# Altium schematic sheet Peripherals.SchDoc (part 2 of 2)
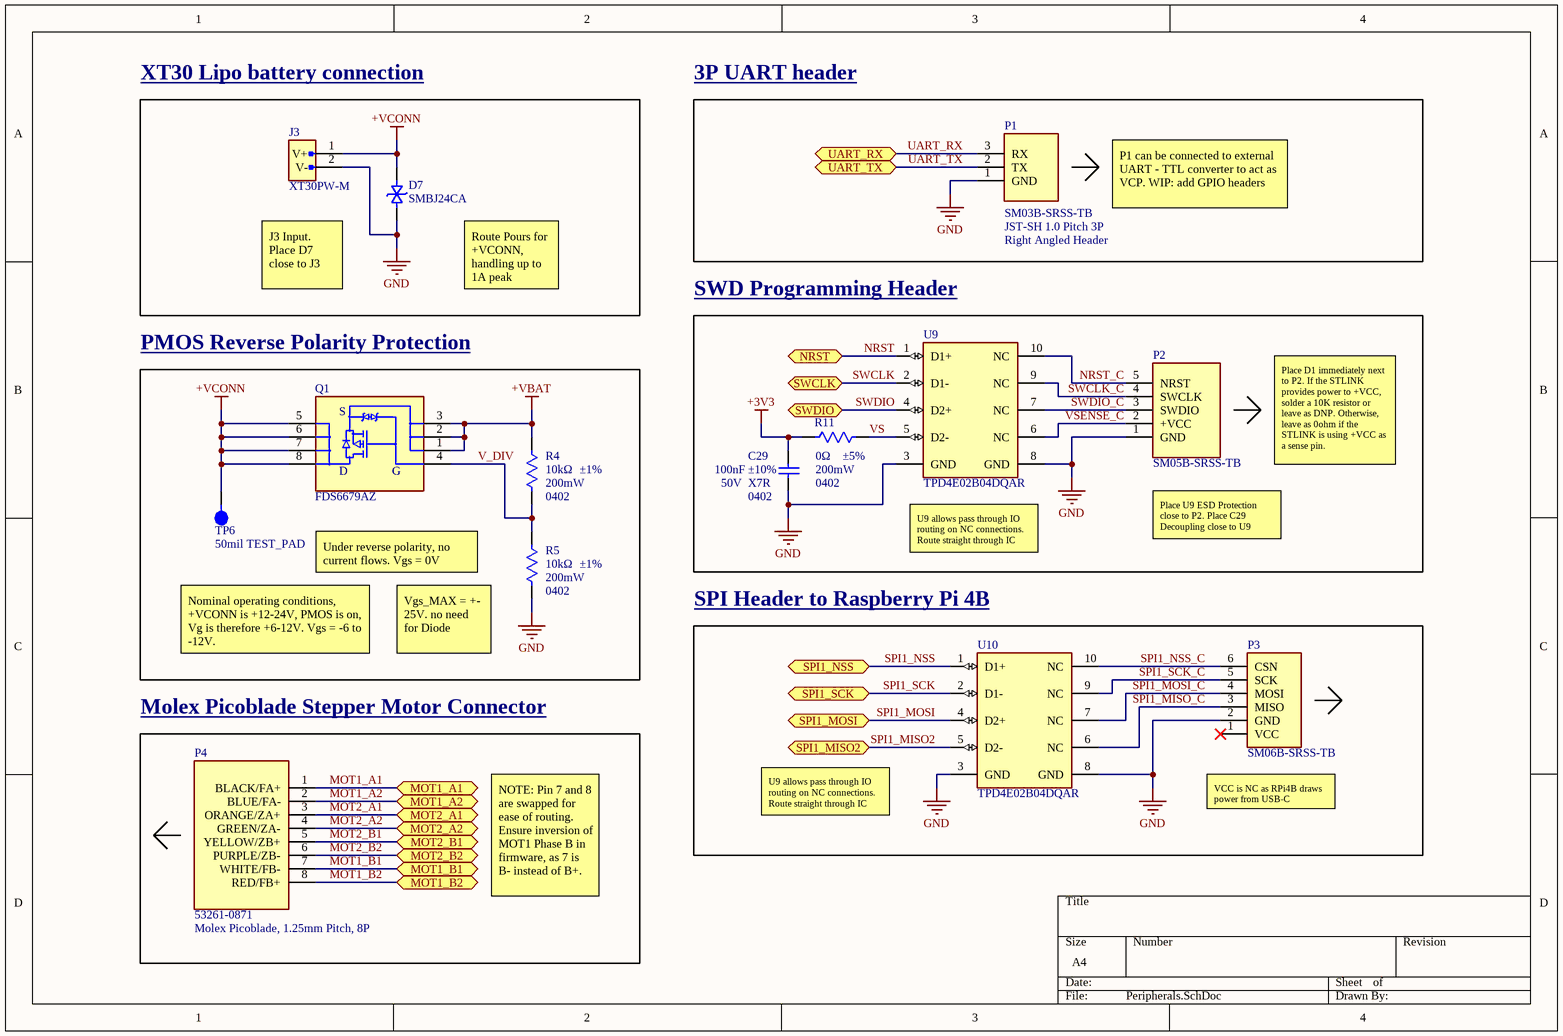
[diagram p1: Peripherals.SchDoc]

## Library data of the parts
C29 = GCM155R71H104KE02J: 50V 100nF X7R ±10% 0402 Multilayer Ceramic Capacitors MLCC - SMD/SMT ROHS; Manufacturer: Murata; Manufacturer Lifecycle Status: IN PRODUCTION; Supplier 1: DigiKey; Manufacturer Part Number: GCM155R71H104KE02J; RoHS: Compliant; Category: Ceramic Capacitors; Stock 1: 13930662; Pricing 1: 1=0.1, 10=0.034, 50=0.0226, 100=0.0193, 500=0.01374, 1000=0.01205, 2500=0.01027, 5000=0.0092 (USD); Case Code (Imperial): 0402; Case Code (Metric): 1005; Country of Origin: Philippines; Dielectric Material: Ceramic; Export Control Classification Number (ECCN) Code: EAR99; Height: 500µm; Harmonized Tariff Schedule (HTS) Code: 8532.24.00.20; Introduction Date: 2013-11-20; Length: 1mm; Lifecycle Status: Production; Material: Ceramic; Max Operating Temperature: 125°C; Min Operating Temperature: -55°C; Mount: Surface Mount; Number of Terminals: 2; Packaging: Tape & Reel (TR); Ratings: AEC-Q200; REACH SVHC: Yes; Schedule B: 8532240020, 8532240020|8532240020, 8532240020|8532240020|8532240020, 8532240020|8532240020|8532240020|8532240020; Termination: SMD/SMT; Voltage Rating (DC): 50V; Weight: 6.010099mg; Width: 500µm; ComponentLink1URL: https://datasheet.octopart.com:443/GCM155R71H104KE02J-Murata-datasheet-155345015.pdf?src-supplier=Newark; ComponentLink1Description: https://datasheet.octopart.com:443/GCM155R71H104KE02J-Murata-datasheet-155345015.pdf?src-supplier=Newark; ComponentLink2URL: https://datasheet.octopart.com:443/GCM155R71H104KE02J-Murata-datasheet-178519985.pdf?src-supplier=Arrow.cn; ComponentLink2Description: https://datasheet.octopart.com:443/GCM155R71H104KE02J-Murata-datasheet-178519985.pdf?src-supplier=Arrow.cn; ComponentLink3URL: https://datasheet.octopart.com:443/GCM155R71H104KE02J-Murata-datasheet-141266224.pdf?src-supplier=Ciiva; ComponentLink3Description: https://datasheet.octopart.com:443/GCM155R71H104KE02J-Murata-datasheet-141266224.pdf?src-supplier=Ciiva; ComponentLink4URL: https://datasheet.octopart.com:443/GCM155R71H104KE02J-Murata-datasheet-140656751.pdf?src-supplier=Ciiva; ComponentLink4Description: https://datasheet.octopart.com:443/GCM155R71H104KE02J-Murata-datasheet-140656751.pdf?src-supplier=Ciiva; ComponentLink5URL: https://datasheet.octopart.com:443/GCM155R71H104KE02J-Murata-datasheet-138716456.pdf?src-supplier=Ciiva; ComponentLink5Description: https://datasheet.octopart.com:443/GCM155R71H104KE02J-Murata-datasheet-138716456.pdf?src-supplier=Ciiva; ComponentLink6URL: https://datasheet.octopart.com:443/GCM155R71H104KE02J-Murata-datasheet-77992203.pdf?src-supplier=Future+Electronics; ComponentLink6Description: https://datasheet.octopart.com:443/GCM155R71H104KE02J-Murata-datasheet-77992203.pdf?src-supplier=Future+Electronics; ComponentLink7URL: https://datasheet.octopart.com:443/GCM155R71H104KE02J-Murata-datasheet-12511495.pdf?src-supplier=TME; ComponentLink7Description: https://datasheet.octopart.com:443/GCM155R71H104KE02J-Murata-datasheet-12511495.pdf?src-supplier=TME; ComponentLink8URL: http://sigma.octopart.com:80/reach_statement/Murata-company-16.pdf?src-supplier=Compliance+Statements; ComponentLink8Description: http://sigma.octopart.com:80/reach_statement/Murata-company-16.pdf?src-supplier=Compliance+Statements; Supplier Part Number 1: 490-14514-6-ND; Capacitance: 100nF
D7 = SMBJ24CA: Diode; 15.5 A (Max.); 26.70 V (Min.) @ 1 mA; 5 uA (Max.) @ 24 V; 100 A (Max.); Manufacturer: Littelfuse; Breakdown Voltage: 28.1V; Clamping Voltage: 38.9V; Direction: Bidirectional; Element Configuration: Single; ESD Protection: Yes; Leakage Current: 1µA; Max Breakdown Voltage: 29.5V; Max Junction Temperature (Tj): 150°C; Max Power Dissipation: 5W; Max Surge Current: 15.5A; Min Breakdown Voltage: 26.7V; Number of Bidirectional Channels: 1; Operating Supply Voltage: 24V; Peak Pulse Power: 600W; Power Line Protection: No; Test Current: 1mA; Supplier 1: Arrow Electronics; Manufacturer Part Number: SMBJ24CA; RoHS: Compliant; Category: TVS Diodes; Stock 1: 36000; Pricing 1: 3000=0.0667 (USD); Case/Package: SMB; China RoHS: Non-Compliant; Composition: Zener; Country of Origin: Mainland China, Philippines; Export Control Classification Number (ECCN) Code: EAR99; Height: 2.61mm; Harmonized Tariff Schedule (HTS) Code: 8541.10.00.50; Introduction Date: 1996-01-01; Lead Free: Lead Free; Length: 4.5466mm; Lifecycle Status: Production; Max Operating Temperature: 150°C; Max Reverse Leakage Current: 1µA; Min Operating Temperature: -65°C; Mount: Surface Mount; Number of Channels: 1; Number of Elements: 1; Number of Pins: 2; Number of Terminals: 2; Packaging: Tape & Reel; Peak Pulse Current: 15.5A; Peak Reverse Current: 1µA; Polarity: Bidirectional; Power Rating: 600W; Radiation Hardening: No; REACH SVHC: No; Reverse Breakdown Voltage: 26.7V; Reverse Standoff Voltage: 24V; Reverse Voltage: 24V; Schedule B: 8541100080, 8541100080|8541100080|8541100080|8541100080|8541100080; Termination: SMD/SMT; Voltage Rating (DC): 24V; Width: 3.937mm; ComponentLink1URL: https://datasheet.octopart.com:443/SMBJ24CA-Littelfuse-datasheet-180609570.pdf?src-supplier=IHS; ComponentLink1Description: https://datasheet.octopart.com:443/SMBJ24CA-Littelfuse-datasheet-180609570.pdf?src-supplier=IHS; ComponentLink2URL: https://datasheet.octopart.com:443/SMBJ24CA-Littelfuse-datasheet-27889791.pdf?src-supplier=Upverter; ComponentLink2Description: https://datasheet.octopart.com:443/SMBJ24CA-Littelfuse-datasheet-27889791.pdf?src-supplier=Upverter; ComponentLink3URL: https://datasheet.octopart.com:443/SMBJ24CA-Littelfuse-datasheet-63710821.pdf?src-supplier=Farnell; ComponentLink3Description: https://datasheet.octopart.com:443/SMBJ24CA-Littelfuse-datasheet-63710821.pdf?src-supplier=Farnell; ComponentLink4URL: https://datasheet.octopart.com:443/SMBJ24CA-Littelfuse-datasheet-145017494.pdf?src-supplier=Farnell; ComponentLink4Description: https://datasheet.octopart.com:443/SMBJ24CA-Littelfuse-datasheet-145017494.pdf?src-supplier=Farnell; ComponentLink5URL: https://datasheet.octopart.com:443/SMBJ24CA-Littelfuse-datasheet-10854588.pdf?src-supplier=element14+APAC; ComponentLink5Description: https://datasheet.octopart.com:443/SMBJ24CA-Littelfuse-datasheet-10854588.pdf?src-supplier=element14+APAC; ComponentLink6URL: https://datasheet.octopart.com:443/SMBJ24CA-Littelfuse-datasheet-5319440.pdf?src-supplier=element14+APAC; ComponentLink6Description: https://datasheet.octopart.com:443/SMBJ24CA-Littelfuse-datasheet-5319440.pdf?src-supplier=element14+APAC; ComponentLink7URL: https://datasheet.octopart.com:443/SMBJ24CA-Littelfuse-datasheet-98958142.pdf?src-supplier=LKR; ComponentLink7Description: https://datasheet.octopart.com:443/SMBJ24CA-Littelfuse-datasheet-98958142.pdf?src-supplier=LKR; ComponentLink8URL: https://datasheet.octopart.com:443/SMBJ24CA-Littelfuse-datasheet-871.pdf?src-supplier=Newark; ComponentLink8Description: https://datasheet.octopart.com:443/SMBJ24CA-Littelfuse-datasheet-871.pdf?src-supplier=Newark; ComponentLink9URL: https://datasheet.octopart.com:443/SMBJ24CA-Littelfuse-datasheet-123574.pdf?src-supplier=Newark; ComponentLink9Description: https://datasheet.octopart.com:443/SMBJ24CA-Littelfuse-datasheet-123574.pdf?src-supplier=Newark; ComponentLink10URL: https://datasheet.octopart.com:443/SMBJ24CA-Littelfuse-datasheet-9692587.pdf?src-supplier=RS+(Formerly+Allied+Electronics); ComponentLink10Description: https://datasheet.octopart.com:443/SMBJ24CA-Littelfuse-datasheet-9692587.pdf?src-supplier=RS+(Formerly+Allied+Electronics); ComponentLink11URL: https://datasheet.octopart.com:443/SMBJ24CA-Littelfuse-datasheet-22888.pdf?src-supplier=RS+(Formerly+Allied+Electronics); ComponentLink11Description: https://datasheet.octopart.com:443/SMBJ24CA-Littelfuse-datasheet-22888.pdf?src-supplier=RS+(Formerly+Allied+Electronics); Supplier Part Number 1: SMBJ24CA
J3 = XT30PW-M: Socket; DC supply; XT30; male; PIN: 2; on PCBs; THT; Colour: yellow; MF: AMASS; SnapEDA_Link: https://www.snapeda.com/parts/XT30PW-M/AMASS/view-part/?ref=snap; Package: None; Value: *; MP: XT30PW-M; Check_prices: https://www.snapeda.com/parts/XT30PW-M/AMASS/view-part/?ref=eda
P1 = SM03B-SRSS-TB_UART: Board Connector, 3 Contact(s), 1 Row(s), Male, Right Angle, Surface Mount Terminal; Manufacturer: JST; Connector Type: Male Pin; Number of Contacts: 3; Pitch: 990.6µm; Supplier 1: DigiKey; Manufacturer Part Number: SM03B-SRSS-TB; RoHS: Compliant; Category: Card Edge Connectors; Stock 1: 14167; Pricing 1: 1=0.44, 10=0.373, 100=0.317, 500=0.2829, 1000=0.26938 (USD); Color: Natural; Contact Gender: Male; Contact Plating: Tin; Housing Color: Natural; Housing Material: Nylon; Lead Free: Contains Lead; Lifecycle Status: Obsolete; Max Operating Temperature: 85°C; Min Operating Temperature: -25°C; Mount: Surface Mount; Number of Pins: 3; Number of Positions: 3; Number of Rows: 1; Orientation: Horizontal; Terminal Pitch: 1mm; Termination: Solder; ComponentLink1URL: https://datasheet.octopart.com:443/SM03B-SRSS-TB-JST-datasheet-180492086.pdf?src-supplier=IHS; ComponentLink1Description: https://datasheet.octopart.com:443/SM03B-SRSS-TB-JST-datasheet-180492086.pdf?src-supplier=IHS; ComponentLink2URL: https://datasheet.octopart.com:443/SM03B-SRSS-TB-JST-datasheet-44103209.pdf?src-supplier=TME; ComponentLink2Description: https://datasheet.octopart.com:443/SM03B-SRSS-TB-JST-datasheet-44103209.pdf?src-supplier=TME; ComponentLink3URL: https://datasheet.octopart.com:443/SM03B-SRSS-TB-JST-datasheet-118603.pdf?src-supplier=DigiKey; ComponentLink3Description: https://datasheet.octopart.com:443/SM03B-SRSS-TB-JST-datasheet-118603.pdf?src-supplier=DigiKey; ComponentLink4URL: https://datasheet.octopart.com:443/SM03B-SRSS-TB-JST-datasheet-152738602.pdf?src-supplier=Amar+Radio+Corporation; ComponentLink4Description: https://datasheet.octopart.com:443/SM03B-SRSS-TB-JST-datasheet-152738602.pdf?src-supplier=Amar+Radio+Corporation
P2 = SM05B-SRSS-TB-SWD: Board Connector, 5 Contact(s), 1 Row(s), Male, Right Angle, Surface Mount Terminal; Manufacturer: JST; Connector Type: Male Pin; Number of Contacts: 5; Pitch: 990.6µm; Supplier 1: DigiKey; Manufacturer Part Number: SM05B-SRSS-TB; RoHS: Compliant; Category: Card Edge Connectors; Stock 1: 42194; Pricing 1: 1=0.62, 10=0.527, 100=0.4477, 500=0.3996, 1000=0.38051 (USD); Color: Natural; Contact Plating: Tin; Export Control Classification Number (ECCN) Code: EAR99; Gender: Male; Housing Color: Natural; Housing Material: Nylon; Harmonized Tariff Schedule (HTS) Code: 8536.69.40.40; Introduction Date: 1996-04-01; Lead Free: Contains Lead; Lifecycle Status: Obsolete; Mount: Surface Mount; Number of Positions: 5; Number of Rows: 1; Orientation: Right Angle; Terminal Pitch: 1mm; Termination: Solder; ComponentLink1URL: https://datasheet.octopart.com:443/SM05B-SRSS-TB-JST-datasheet-180492086.pdf?src-supplier=IHS; ComponentLink1Description: https://datasheet.octopart.com:443/SM05B-SRSS-TB-JST-datasheet-180492086.pdf?src-supplier=IHS; ComponentLink2URL: https://datasheet.octopart.com:443/SM05B-SRSS-TB-JST-datasheet-118603.pdf?src-supplier=DigiKey; ComponentLink2Description: https://datasheet.octopart.com:443/SM05B-SRSS-TB-JST-datasheet-118603.pdf?src-supplier=DigiKey; ComponentLink3URL: https://datasheet.octopart.com:443/SM05B-SRSS-TB-JST-datasheet-152738602.pdf?src-supplier=Amar+Radio+Corporation; ComponentLink3Description: https://datasheet.octopart.com:443/SM05B-SRSS-TB-JST-datasheet-152738602.pdf?src-supplier=Amar+Radio+Corporation
P3 = SM06B-SRSS-TB_SPI: Board Connector, 6 Contact(s), 1 Row(s), Male, Right Angle, 0.039 inch Pitch, Surface Mount Terminal; Manufacturer: JST; Connector Type: Male Pin; Dielectric Material: Polyamide; Number of Contacts: 6; Pitch: 990.6µm; Supplier 1: DigiKey; Manufacturer Part Number: SM06B-SRSS-TB; RoHS: Compliant; Category: Card Edge Connectors; Stock 1: 26532; Pricing 1: 1=0.67, 10=0.567, 100=0.4821, 500=0.43024, 1000=0.40969 (USD); Color: Natural; Contact Gender: Male; Contact Plating: Tin; Housing Color: Natural; Housing Material: Nylon; Lead Free: Contains Lead; Lifecycle Status: Obsolete; Max Operating Temperature: 85°C; Manufacturer Package Identifier: SM06B-SRSS-TB; Min Operating Temperature: -25°C; Mount: Surface Mount; Number of Pins: 6; Number of Positions: 6; Number of Rows: 1; Orientation: Horizontal; Terminal Pitch: 1mm; Termination: Solder; ComponentLink1URL: https://datasheet.octopart.com:443/SM06B-SRSS-TB-JST-datasheet-118603.pdf?src-supplier=Upverter; ComponentLink1Description: https://datasheet.octopart.com:443/SM06B-SRSS-TB-JST-datasheet-118603.pdf?src-supplier=Upverter; ComponentLink2URL: https://datasheet.octopart.com:443/SM06B-SRSS-TB-JST-datasheet-180492086.pdf?src-supplier=IHS; ComponentLink2Description: https://datasheet.octopart.com:443/SM06B-SRSS-TB-JST-datasheet-180492086.pdf?src-supplier=IHS; ComponentLink3URL: https://datasheet.octopart.com:443/SM06B-SRSS-TB-JST-datasheet-44103209.pdf?src-supplier=TME; ComponentLink3Description: https://datasheet.octopart.com:443/SM06B-SRSS-TB-JST-datasheet-44103209.pdf?src-supplier=TME; ComponentLink4URL: https://datasheet.octopart.com:443/SM06B-SRSS-TB-JST-datasheet-152738602.pdf?src-supplier=Amar+Radio+Corporation; ComponentLink4Description: https://datasheet.octopart.com:443/SM06B-SRSS-TB-JST-datasheet-152738602.pdf?src-supplier=Amar+Radio+Corporation
P4 = 53261-0871: 1.25mm (.049") Pitch PicoBlade Header, Surface Mount, Right Angle, Lead-free, 8 Circuits; Manufacturer: Molex; Manufacturer Lifecycle Status: ACTIVE; Contact Resistance: 20mΩ; Current Rating: 1A; Gender: Male; Glow Wire Compliant: Non-compliant; Insulation Resistance: 100MΩ; Number of Circuits: 7; Number of Contacts: 8; Pitch: 1.2446mm; Plating: Tin; Plating Thickness: 990.6nm; Ratings: CSA; Voltage Rating: 125V; Supplier 1: DigiKey; Manufacturer Part Number: 53261-0871; RoHS: Compliant; Category: Headers and Wire Housings; Stock 1: 32917; Pricing 1: 1=0.91, 10=0.772, 100=0.6556, 500=0.58518 (USD); Ambient Temperature Range High: 105°C; China RoHS: Compliant; Color: Beige; Contact Material: Nickel, Tin; Contact Plating: Tin; Country of Origin: SG; Flammability Rating: UL94 V-0; Height: 3.6mm; Lead Free: Lead Free; Lead Pitch: 1.25mm; Lifecycle Status: Production; Max Operating Temperature: 105°C; Min Operating Temperature: -40°C; Mount: Surface Mount; Number of Pins: 8; Number of Positions: 8; Number of Rows: 1; Orientation: Right Angle; Packaging: Cut Tape; Radiation Hardening: No; REACH SVHC: Yes; Schedule B: 8536694040, 8536694040|8536694040|8536694040|8536694040|8536694040|8536694040|8536694040|8536694040|8536694040|8536694040|8536694040|8536694040|8536694040|8536694040|8536694040|8536694040|8536694040|8536694040|8536694040|8536694040|8536694040|8536694040|8536694040|85; Terminal Pitch: 1.25mm; Termination: Solder; Voltage Rating (AC): 125V; Voltage Rating (DC): 125V; Working Voltage: 125V; ComponentLink1URL: https://datasheet.octopart.com:443/53261-0871-Molex-datasheet-177725531.pdf?src-supplier=Farnell; ComponentLink1Description: https://datasheet.octopart.com:443/53261-0871-Molex-datasheet-177725531.pdf?src-supplier=Farnell; ComponentLink2URL: https://datasheet.octopart.com:443/53261-0871-Molex-datasheet-11023919.pdf?src-supplier=Farnell; ComponentLink2Description: https://datasheet.octopart.com:443/53261-0871-Molex-datasheet-11023919.pdf?src-supplier=Farnell; ComponentLink3URL: https://datasheet.octopart.com:443/53261-0871-Molex-datasheet-101583405.pdf?src-supplier=Farnell; ComponentLink3Description: https://datasheet.octopart.com:443/53261-0871-Molex-datasheet-101583405.pdf?src-supplier=Farnell; ComponentLink4URL: https://datasheet.octopart.com:443/532610871-Molex-datasheet-520094.pdf?src-supplier=Farnell; ComponentLink4Description: https://datasheet.octopart.com:443/532610871-Molex-datasheet-520094.pdf?src-supplier=Farnell; ComponentLink5URL: https://sigma.octopart.com:443/140425834/technical_drawing/Molex-53261-0871.pdf?src-supplier=Upverter; ComponentLink5Description: https://sigma.octopart.com:443/140425834/technical_drawing/Molex-53261-0871.pdf?src-supplier=Upverter; ComponentLink6URL: https://datasheet.octopart.com:443/53261-0871-Molex-datasheet-140462602.pdf?src-supplier=Upverter; ComponentLink6Description: https://datasheet.octopart.com:443/53261-0871-Molex-datasheet-140462602.pdf?src-supplier=Upverter; ComponentLink7URL: https://datasheet.octopart.com:443/53261-0871-Molex-datasheet-12537161.pdf?src-supplier=_legacy+Avnet; ComponentLink7Description: https://datasheet.octopart.com:443/53261-0871-Molex-datasheet-12537161.pdf?src-supplier=_legacy+Avnet; ComponentLink8URL: https://datasheet.octopart.com:443/532610871-Molex-datasheet-8343080.pdf?src-supplier=TME; ComponentLink8Description: https://datasheet.octopart.com:443/532610871-Molex-datasheet-8343080.pdf?src-supplier=TME; ComponentLink9URL: https://datasheet.octopart.com:443/53261-0871-Molex-datasheet-10404416.pdf?src-supplier=Molex; ComponentLink9Description: https://datasheet.octopart.com:443/53261-0871-Molex-datasheet-10404416.pdf?src-supplier=Molex; ComponentLink10URL: https://sigma.octopart.com:443/16413766/technical_drawing/Molex-53261-0871.pdf?src-supplier=Molex; ComponentLink10Description: https://sigma.octopart.com:443/16413766/technical_drawing/Molex-53261-0871.pdf?src-supplier=Molex; ComponentLink11URL: https://datasheet.octopart.com:443/53261-0871-Molex-datasheet-154756037.pdf?src-supplier=Master+Electronics; ComponentLink11Description: https://datasheet.octopart.com:443/53261-0871-Molex-datasheet-154756037.pdf?src-supplier=Master+Electronics; ComponentLink12URL: https://datasheet.octopart.com:443/53261-0871-Molex-datasheet-21208676.pdf?src-supplier=Electro+Sonic; ComponentLink12Description: https://datasheet.octopart.com:443/53261-0871-Molex-datasheet-21208676.pdf?src-supplier=Electro+Sonic; ComponentLink13URL: https://datasheet.octopart.com:443/53261-0871-Molex-datasheet-62105452.pdf?src-supplier=Electro+Sonic; ComponentLink13Description: https://datasheet.octopart.com:443/53261-0871-Molex-datasheet-62105452.pdf?src-supplier=Electro+Sonic; ComponentLink14URL: https://datasheet.octopart.com:443/53261-0871-Molex-datasheet-8522546.pdf?src-supplier=element14; ComponentLink14Description: https://datasheet.octopart.com:443/53261-0871-Molex-datasheet-8522546.pdf?src-supplier=element14; ComponentLink15URL: https://datasheet.octopart.com:443/53261-0871-Molex-datasheet-100429.pdf?src-supplier=element14; ComponentLink15Description: https://datasheet.octopart.com:443/53261-0871-Molex-datasheet-100429.pdf?src-supplier=element14; ComponentLink16URL: https://datasheet.octopart.com:443/0532610871-Molex-datasheet-157440116.pdf?src-supplier=Sager+Electronics; ComponentLink16Description: https://datasheet.octopart.com:443/0532610871-Molex-datasheet-157440116.pdf?src-supplier=Sager+Electronics; ComponentLink17URL: https://datasheet.octopart.com:443/53261-0871-Molex-datasheet-140186590.pdf?src-supplier=RS+(Formerly+Allied+Electronics); ComponentLink17Description: https://datasheet.octopart.com:443/53261-0871-Molex-datasheet-140186590.pdf?src-supplier=RS+(Formerly+Allied+Electronics); ComponentLink18URL: https://datasheet.octopart.com:443/53261-0871-Molex-datasheet-120153903.pdf?src-supplier=RS+(Formerly+Allied+Electronics); ComponentLink18Description: https://datasheet.octopart.com:443/53261-0871-Molex-datasheet-120153903.pdf?src-supplier=RS+(Formerly+Allied+Electronics); ComponentLink19URL: https://datasheet.octopart.com:443/53261-0871-Molex-datasheet-34442330.pdf?src-supplier=RS+(Formerly+Allied+Electronics); ComponentLink19Description: https://datasheet.octopart.com:443/53261-0871-Molex-datasheet-34442330.pdf?src-supplier=RS+(Formerly+Allied+Electronics); ComponentLink20URL: https://datasheet.octopart.com:443/532610871-Molex-datasheet-137316104.pdf?src-supplier=Future+Electronics; ComponentLink20Description: https://datasheet.octopart.com:443/532610871-Molex-datasheet-137316104.pdf?src-supplier=Future+Electronics; ComponentLink21URL: https://datasheet.octopart.com:443/53261-0871-Molex-datasheet-33003884.pdf?src-supplier=Newark; ComponentLink21Description: https://datasheet.octopart.com:443/53261-0871-Molex-datasheet-33003884.pdf?src-supplier=Newark; ComponentLink22URL: https://datasheet.octopart.com:443/53261-0871-Molex-datasheet-33003883.pdf?src-supplier=Newark; ComponentLink22Description: https://datasheet.octopart.com:443/53261-0871-Molex-datasheet-33003883.pdf?src-supplier=Newark; ComponentLink23URL: https://datasheet.octopart.com:443/0532610871-Molex-datasheet-11889475.pdf?src-supplier=Arrow+Electronics; ComponentLink23Description: https://datasheet.octopart.com:443/0532610871-Molex-datasheet-11889475.pdf?src-supplier=Arrow+Electronics; ComponentLink24URL: https://datasheet.octopart.com:443/53261-0871-Molex-datasheet-17741852.pdf?src-supplier=Jameco+(USA); ComponentLink24Description: https://datasheet.octopart.com:443/53261-0871-Molex-datasheet-17741852.pdf?src-supplier=Jameco+(USA); ComponentLink25URL: https://datasheet.octopart.com:443/53261-0871-Molex-datasheet-145971.pdf?src-supplier=DigiKey; ComponentLink25Description: https://datasheet.octopart.com:443/53261-0871-Molex-datasheet-145971.pdf?src-supplier=DigiKey; ComponentLink26URL: http://sigma.octopart.com:80/16413779/rohs_statement/Molex-53261-0871.pdf?src-supplier=Compliance+Statements; ComponentLink26Description: http://sigma.octopart.com:80/16413779/rohs_statement/Molex-53261-0871.pdf?src-supplier=Compliance+Statements; ComponentLink27URL: http://sigma.octopart.com:80/reach_statement/Molex-company-74.pdf?src-supplier=Compliance+Statements; ComponentLink27Description: http://sigma.octopart.com:80/reach_statement/Molex-company-74.pdf?src-supplier=Compliance+Statements; ComponentLink28URL: http://sigma.octopart.com:80/rohs_statement/Molex-company-73.pdf?src-supplier=Compliance+Statements; ComponentLink28Description: http://sigma.octopart.com:80/rohs_statement/Molex-company-73.pdf?src-supplier=Compliance+Statements; ComponentLink29URL: http://sigma.octopart.com:80/conflict_mineral_statement/Molex-company-72.pdf?src-supplier=Compliance+Statements; ComponentLink29Description: http://sigma.octopart.com:80/conflict_mineral_statement/Molex-company-72.pdf?src-supplier=Compliance+Statements; Supplier Part Number 1: WM7626CT-ND
Q1 = FDS6679AZ: P-Channel 30 V 9.3 mOhm Surface Mount PowerTrench Mosfet - SOIC-8; Manufacturer: onsemi; Manufacturer Lifecycle Status: ACTIVE; Continuous Drain Current (ID): 13A; Current Rating: -13A; Drain to Source Breakdown Voltage: -30V; Drain to Source Resistance: 9.3mΩ; Element Configuration: Single; Fall Time: 92ns; Gate to Source Voltage (Vgs): 25V; Input Capacitance: 3.845nF; Max Junction Temperature (Tj): 150°C; Max Power Dissipation: 2.5W; Min Breakdown Voltage: 30V; Nominal Vgs: -1.9V; Number of Channels: 1; Power Dissipation: 1W; Rise Time: 15ns; Turn-Off Delay Time: 210ns; Turn-On Delay Time: 13ns; Supplier 1: DigiKey; Manufacturer Part Number: FDS6679AZ; RoHS: Compliant; Category: MOSFETs; Stock 1: 5617; Pricing 1: 1=1.6, 10=1.014, 100=0.6743, 500=0.5287, 1000=0.48185 (USD); Case/Package: SOIC; China RoHS: Compliant; Contact Plating: Tin; Country of Origin: Philippines; Drain to Source Voltage (Vdss): -30V; Export Control Classification Number (ECCN) Code: EAR99; Height: 1.75mm; Harmonized Tariff Schedule (HTS) Code: 8541.29.00.95; Introduction Date: 2006-02-10; Lead Free: Lead Free; Length: 5mm; Lifecycle Status: Production; Max Operating Temperature: 150°C; Min Operating Temperature: -55°C; Mount: Surface Mount; Number of Elements: 1; Number of Pins: 8; Number of Terminals: 8; Packaging: Tape & Reel; Radiation Hardening: No; Rds On Max: 9.3mΩ; REACH SVHC: Yes; Resistance: 9.3MΩ; Schedule B: 8541290080, 8541290080|8541290080|8541290080|8541290080|8541290080; Threshold Voltage: -1.9V; Voltage Rating (DC): -30V; Weight: 130mg; Width: 4mm; ComponentLink1URL: https://datasheet.octopart.com:443/FDS6679AZ-ON-Semiconductor-datasheet-5375043.pdf?src-supplier=element14+APAC; ComponentLink1Description: https://datasheet.octopart.com:443/FDS6679AZ-ON-Semiconductor-datasheet-5375043.pdf?src-supplier=element14+APAC; ComponentLink2URL: https://datasheet.octopart.com:443/FDS6679AZ-ON-Semiconductor-datasheet-80928664.pdf?src-supplier=element14+APAC; ComponentLink2Description: https://datasheet.octopart.com:443/FDS6679AZ-ON-Semiconductor-datasheet-80928664.pdf?src-supplier=element14+APAC; ComponentLink3URL: https://datasheet.octopart.com:443/FDS6679AZ-Fairchild-Semiconductor-datasheet-76739748.pdf?src-supplier=element14+APAC; ComponentLink3Description: https://datasheet.octopart.com:443/FDS6679AZ-Fairchild-Semiconductor-datasheet-76739748.pdf?src-supplier=element14+APAC; ComponentLink4URL: https://datasheet.octopart.com:443/FDS6679AZ.-Fairchild-Semiconductor-datasheet-68450872.pdf?src-supplier=element14+APAC; ComponentLink4Description: https://datasheet.octopart.com:443/FDS6679AZ.-Fairchild-Semiconductor-datasheet-68450872.pdf?src-supplier=element14+APAC; ComponentLink5URL: https://datasheet.octopart.com:443/FDS6679AZ.-Fairchild-Semiconductor-datasheet-76739753.pdf?src-supplier=element14+APAC; ComponentLink5Description: https://datasheet.octopart.com:443/FDS6679AZ.-Fairchild-Semiconductor-datasheet-76739753.pdf?src-supplier=element14+APAC; ComponentLink6URL: https://datasheet.octopart.com:443/FDS6679AZ-onsemi-datasheet-164563882.pdf?src-supplier=IHS; ComponentLink6Description: https://datasheet.octopart.com:443/FDS6679AZ-onsemi-datasheet-164563882.pdf?src-supplier=IHS; ComponentLink7URL: https://sigma.octopart.com:443/138897548/technical_drawing/onsemi-FDS6679AZ.pdf?src-supplier=Upverter; ComponentLink7Description: https://sigma.octopart.com:443/138897548/technical_drawing/onsemi-FDS6679AZ.pdf?src-supplier=Upverter; ComponentLink8URL: https://datasheet.octopart.com:443/FDS6679AZ-ON-Semiconductor-datasheet-97399181.pdf?src-supplier=Future+Electronics; ComponentLink8Description: https://datasheet.octopart.com:443/FDS6679AZ-ON-Semiconductor-datasheet-97399181.pdf?src-supplier=Future+Electronics; ComponentLink9URL: https://datasheet.octopart.com:443/FDS6679AZ-ON-Semiconductor-datasheet-86694006.pdf?src-supplier=onsemi; ComponentLink9Description: https://datasheet.octopart.com:443/FDS6679AZ-ON-Semiconductor-datasheet-86694006.pdf?src-supplier=onsemi; ComponentLink10URL: https://datasheet.octopart.com:443/FDS6679AZ-ON-Semiconductor-datasheet-86689283.pdf?src-supplier=Farnell; ComponentLink10Description: https://datasheet.octopart.com:443/FDS6679AZ-ON-Semiconductor-datasheet-86689283.pdf?src-supplier=Farnell; ComponentLink11URL: https://datasheet.octopart.com:443/FDS6679AZ-Fairchild-Semiconductor-datasheet-67356198.pdf?src-supplier=Farnell; ComponentLink11Description: https://datasheet.octopart.com:443/FDS6679AZ-Fairchild-Semiconductor-datasheet-67356198.pdf?src-supplier=Farnell; ComponentLink12URL: https://datasheet.octopart.com:443/FDS6679AZ.-Fairchild-Semiconductor-datasheet-81472158.pdf?src-supplier=Farnell; ComponentLink12Description: https://datasheet.octopart.com:443/FDS6679AZ.-Fairchild-Semiconductor-datasheet-81472158.pdf?src-supplier=Farnell; ComponentLink13URL: https://datasheet.octopart.com:443/FDS6679AZ-Fairchild-Semiconductor-datasheet-68333325.pdf?src-supplier=Newark; ComponentLink13Description: https://datasheet.octopart.com:443/FDS6679AZ-Fairchild-Semiconductor-datasheet-68333325.pdf?src-supplier=Newark; ComponentLink14URL: https://datasheet.octopart.com:443/FDS6679AZ-Fairchild-datasheet-134401.pdf?src-supplier=Mouser; ComponentLink14Description: https://datasheet.octopart.com:443/FDS6679AZ-Fairchild-datasheet-134401.pdf?src-supplier=Mouser; ComponentLink15URL: https://sigma.octopart.com:443/33068652/technical_drawing/Fairchild-Semiconductor-FDS6679AZ.pdf?src-supplier=Fairchild+Semiconductor; ComponentLink15Description: https://sigma.octopart.com:443/33068652/technical_drawing/Fairchild-Semiconductor-FDS6679AZ.pdf?src-supplier=Fairchild+Semiconductor; ComponentLink16URL: https://sigma.octopart.com:443/17345426/technical_drawing/Fairchild-Semiconductor-FDS6679AZ.pdf?src-supplier=Fairchild+Semiconductor; ComponentLink16Description: https://sigma.octopart.com:443/17345426/technical_drawing/Fairchild-Semiconductor-FDS6679AZ.pdf?src-supplier=Fairchild+Semiconductor; ComponentLink17URL: https://datasheet.octopart.com:443/FDS6679AZ-Fairchild-Semiconductor-datasheet-14042453.pdf?src-supplier=iiiC; ComponentLink17Description: https://datasheet.octopart.com:443/FDS6679AZ-Fairchild-Semiconductor-datasheet-14042453.pdf?src-supplier=iiiC; ComponentLink18URL: https://datasheet.octopart.com:443/FDS6679AZ-Fairchild-datasheet-7560025.pdf?src-supplier=Jameco+(USA); ComponentLink18Description: https://datasheet.octopart.com:443/FDS6679AZ-Fairchild-datasheet-7560025.pdf?src-supplier=Jameco+(USA); ComponentLink19URL: https://datasheet.octopart.com:443/FDS6679AZ-ON-Semiconductor-datasheet-81454864.pdf?src-supplier=TME; ComponentLink19Description: https://datasheet.octopart.com:443/FDS6679AZ-ON-Semiconductor-datasheet-81454864.pdf?src-supplier=TME; ComponentLink20URL: http://sigma.octopart.com:80/150609504/rohs_statement/ON-Semiconductor-FDS6679AZ.pdf?src-supplier=Compliance+Statements; ComponentLink20Description: http://sigma.octopart.com:80/150609504/rohs_statement/ON-Semiconductor-FDS6679AZ.pdf?src-supplier=Compliance+Statements; ComponentLink21URL: http://sigma.octopart.com:80/17348684/reach_statement/Fairchild-Semiconductor-FDS6679AZ.pdf?src-supplier=Compliance+Statements; ComponentLink21Description: http://sigma.octopart.com:80/17348684/reach_statement/Fairchild-Semiconductor-FDS6679AZ.pdf?src-supplier=Compliance+Statements; ComponentLink22URL: http://sigma.octopart.com:80/17348685/materials_sheet/Fairchild-Semiconductor-FDS6679AZ.pdf?src-supplier=Compliance+Statements; ComponentLink22Description: http://sigma.octopart.com:80/17348685/materials_sheet/Fairchild-Semiconductor-FDS6679AZ.pdf?src-supplier=Compliance+Statements; ComponentLink23URL: http://sigma.octopart.com:80/33158879/reach_statement/Fairchild-Semiconductor-FDS6679AZ.pdf?src-supplier=Compliance+Statements; ComponentLink23Description: http://sigma.octopart.com:80/33158879/reach_statement/Fairchild-Semiconductor-FDS6679AZ.pdf?src-supplier=Compliance+Statements; ComponentLink24URL: http://sigma.octopart.com:80/33158880/materials_sheet/Fairchild-Semiconductor-FDS6679AZ.pdf?src-supplier=Compliance+Statements; ComponentLink24Description: http://sigma.octopart.com:80/33158880/materials_sheet/Fairchild-Semiconductor-FDS6679AZ.pdf?src-supplier=Compliance+Statements; ComponentLink25URL: http://sigma.octopart.com:80/reach_statement/ON-Semiconductor-company-79.pdf?src-supplier=Compliance+Statements; ComponentLink25Description: http://sigma.octopart.com:80/reach_statement/ON-Semiconductor-company-79.pdf?src-supplier=Compliance+Statements; ComponentLink26URL: http://sigma.octopart.com:80/rohs_statement/Fairchild-Semiconductor-company-11.pdf?src-supplier=Compliance+Statements; ComponentLink26Description: http://sigma.octopart.com:80/rohs_statement/Fairchild-Semiconductor-company-11.pdf?src-supplier=Compliance+Statements; ComponentLink27URL: http://sigma.octopart.com:80/rohs_statement/Fairchild-Semiconductor-company-10.pdf?src-supplier=Compliance+Statements; ComponentLink27Description: http://sigma.octopart.com:80/rohs_statement/Fairchild-Semiconductor-company-10.pdf?src-supplier=Compliance+Statements; ComponentLink28URL: http://sigma.octopart.com:80/reach_statement/Fairchild-Semiconductor-company-9.pdf?src-supplier=Compliance+Statements; ComponentLink28Description: http://sigma.octopart.com:80/reach_statement/Fairchild-Semiconductor-company-9.pdf?src-supplier=Compliance+Statements; ComponentLink29URL: https://octopart.com:443/opatz8j6/c1?t=4Oyv1LeYDwsIO8L8qxQnp0Po6zMXl8PVunE5UiW0_1Bf78CsT5cMW5W_So7H97X-5uZqy10zpPfasuUzqws5XcA_VLbS_Vmy49KZ9zHEf3iAc4ZVb1M_py9SYM3VXHeAlV9HyxbpUjeAPKzpdYUkIAiGNTIKx_vY4ccOv8BgSbfTJvDzkdH7ATfYqb_sp8ru4jOmUW4dugF50iKlz9arCwnIFEqhjjMjX_ed4t013HY1KSFvUQs2GqNvLntOFqVyAt7EXZGWR18BgLCKypZUFf3O_xG4PCkF-dQo7bkL8qumxNpXvF6Z7zCsxEJ2JooRVMS_eTz7IFZK3s_4GmjsTwl5e85-ts-eKpT1lQ&src-supplier=Compliance+Statements; ComponentLink29Description: https://octopart.com:443/opatz8j6/c1?t=4Oyv1LeYDwsIO8L8qxQnp0Po6zMXl8PVunE5UiW0_1Bf78CsT5cMW5W_So7H97X-5uZqy10zpPfasuUzqws5XcA_VLbS_Vmy49KZ9zHEf3iAc4ZVb1M_py9SYM3VXHeAlV9HyxbpUjeAPKzpdYUkIAiGNTIKx_vY4ccOv8BgSbfTJvDzkdH7ATfYqb_sp8ru4jOmUW4dugF50iKlz9arCwnIFEqhjjMjX_ed4t013HY1KSFvUQs2GqNvLntOFqVyAt7EXZGWR18BgLCKypZUFf3O_xG4PCkF-dQo7bkL8qumxNpXvF6Z7zCsxEJ2JooRVMS_eTz7IFZK3s_4GmjsTwl5e85-ts-eKpT1lQ&src-supplier=Compliance+Statements; ComponentLink30URL: https://octopart.com:443/opatz8j6/c1?t=ro154g7lIH210tO7A-0mZYocg1Pbp4WsDD3XZDbut1bw2jBa9w6_1LdNP9-Qq6aexq707JuPiwPhsmxgoYagU0tPwqO5I0AKiZiVNdlAg6nAYnNdV4VaMLOu9w-f4PziN1DKoxGZRy8qRpFrVrvqhRs-IKM6OllR7zJ6hZihJTEtiI-5FOMyJt84xMxmfP08vPavb950UTp4nIlg1AW8hk9TwH2TiLBdHh1UOVacYv-0h4uUxi15b1Hu0TXqCekUOwWxBGHv-L2QL5KbfwI6Jd65b913C0EJMXn4STbGZm_HsSjtXg6q9l6TimFEk84htLlMH5oebCTFyNEoxkQ0FMkMRQTO58nPJavdja4&src-supplier=Compliance+Statements; ComponentLink30Description: https://octopart.com:443/opatz8j6/c1?t=ro154g7lIH210tO7A-0mZYocg1Pbp4WsDD3XZDbut1bw2jBa9w6_1LdNP9-Qq6aexq707JuPiwPhsmxgoYagU0tPwqO5I0AKiZiVNdlAg6nAYnNdV4VaMLOu9w-f4PziN1DKoxGZRy8qRpFrVrvqhRs-IKM6OllR7zJ6hZihJTEtiI-5FOMyJt84xMxmfP08vPavb950UTp4nIlg1AW8hk9TwH2TiLBdHh1UOVacYv-0h4uUxi15b1Hu0TXqCekUOwWxBGHv-L2QL5KbfwI6Jd65b913C0EJMXn4STbGZm_HsSjtXg6q9l6TimFEk84htLlMH5oebCTFyNEoxkQ0FMkMRQTO58nPJavdja4&src-supplier=Compliance+Statements; Supplier Part Number 1: FDS6679AZCT-ND
R4 R5 = CRCW040210K0FKEDHP: 10kΩ Res Thick Film 0402 10K Ohm 1% 0.2W ±100ppm/°C Molded SMD SMD Paper T/R; Manufacturer: Vishay; Manufacturer Package Identifier: CRCW0402-HPe3; Voltage Rating: 50V; Supplier 1: DigiKey; Manufacturer Part Number: CRCW040210K0FKEDHP; RoHS: Compliant; Category: Chip SMD Resistors; Stock 1: 168325; Pricing 1: 1=0.12, 10=0.057, 25=0.0436, 50=0.0362, 100=0.0303, 250=0.02452, 500=0.02122, 1000=0.0186, 5000=0.01445 (USD); Case Code (Imperial): 0402; Case Code (Metric): 1005; China RoHS: Non-Compliant; Composition: Thick Film; Contact Plating: Tin; Country of Origin: Israel, Mainland China; Depth: 500µm; Export Control Classification Number (ECCN) Code: EAR99; Height: 300µm; Harmonized Tariff Schedule (HTS) Code: 8533.21.00.30; Introduction Date: 2008-07-29; Lead Free: Lead Free; Length: 1mm; Lifecycle Status: Production; Max Operating Temperature: 155°C; Military Standard: Not; Min Operating Temperature: -55°C; Mount: Surface Mount; Number of Pins: 2; Number of Terminals: 2; Packaging: Cut Tape; Radiation Hardening: No; Ratings: AEC-Q200; REACH SVHC: Yes; Schedule B: 8533210045; Temperature Coefficient: 100ppm/°C; Termination: SMD/SMT; Voltage Rating (DC): 50V; Weight: 652.039032µg; Width: 500µm; Working Voltage: 50V; ComponentLink1URL: https://datasheet.octopart.com/CRCW040210K0FKEDHP-Vishay-datasheet-83567917.pdf; ComponentLink1Description: https://datasheet.octopart.com/CRCW040210K0FKEDHP-Vishay-datasheet-83567917.pdf; ComponentLink2URL: https://datasheet.octopart.com:443/CRCW040210K0FKEDHP-Vishay-datasheet-13148866.pdf?src-supplier=Newark; ComponentLink2Description: https://datasheet.octopart.com:443/CRCW040210K0FKEDHP-Vishay-datasheet-13148866.pdf?src-supplier=Newark; ComponentLink3URL: https://datasheet.octopart.com:443/CRCW040210K0FKEDHP-Vishay-datasheet-13131392.pdf?src-supplier=Newark; ComponentLink3Description: https://datasheet.octopart.com:443/CRCW040210K0FKEDHP-Vishay-datasheet-13131392.pdf?src-supplier=Newark; ComponentLink4URL: https://datasheet.octopart.com:443/CRCW040210K0FKEDHP-Vishay-datasheet-12593106.pdf?src-supplier=Newark; ComponentLink4Description: https://datasheet.octopart.com:443/CRCW040210K0FKEDHP-Vishay-datasheet-12593106.pdf?src-supplier=Newark; ComponentLink5URL: https://datasheet.octopart.com:443/CRCW040210K0FKEDHP-Vishay-datasheet-12544674.pdf?src-supplier=Newark; ComponentLink5Description: https://datasheet.octopart.com:443/CRCW040210K0FKEDHP-Vishay-datasheet-12544674.pdf?src-supplier=Newark; ComponentLink6URL: https://datasheet.octopart.com:443/CRCW040210K0FKEDHP-Vishay-datasheet-12531795.pdf?src-supplier=Newark; ComponentLink6Description: https://datasheet.octopart.com:443/CRCW040210K0FKEDHP-Vishay-datasheet-12531795.pdf?src-supplier=Newark; ComponentLink7URL: https://datasheet.octopart.com:443/CRCW040210K0FKEDHP-Vishay-datasheet-12518686.pdf?src-supplier=Newark; ComponentLink7Description: https://datasheet.octopart.com:443/CRCW040210K0FKEDHP-Vishay-datasheet-12518686.pdf?src-supplier=Newark; ComponentLink8URL: https://datasheet.octopart.com:443/CRCW040210K0FKEDHP-Vishay-datasheet-12509906.pdf?src-supplier=Newark; ComponentLink8Description: https://datasheet.octopart.com:443/CRCW040210K0FKEDHP-Vishay-datasheet-12509906.pdf?src-supplier=Newark; ComponentLink9URL: https://datasheet.octopart.com:443/CRCW040210K0FKEDHP-Vishay-datasheet-10669844.pdf?src-supplier=Newark; ComponentLink9Description: https://datasheet.octopart.com:443/CRCW040210K0FKEDHP-Vishay-datasheet-10669844.pdf?src-supplier=Newark; ComponentLink10URL: https://datasheet.octopart.com:443/CRCW040210K0FKEDHP-Vishay-datasheet-8703221.pdf?src-supplier=Newark; ComponentLink10Description: https://datasheet.octopart.com:443/CRCW040210K0FKEDHP-Vishay-datasheet-8703221.pdf?src-supplier=Newark; ComponentLink11URL: https://datasheet.octopart.com:443/CRCW040210K0FKEDHP.-Vishay-datasheet-78776210.pdf?src-supplier=Newark; ComponentLink11Description: https://datasheet.octopart.com:443/CRCW040210K0FKEDHP.-Vishay-datasheet-78776210.pdf?src-supplier=Newark; ComponentLink12URL: https://datasheet.octopart.com:443/CRCW040210K0FKEDHP-Vishay-datasheet-21268118.pdf?src-supplier=Newark; ComponentLink12Description: https://datasheet.octopart.com:443/CRCW040210K0FKEDHP-Vishay-datasheet-21268118.pdf?src-supplier=Newark; ComponentLink13URL: https://datasheet.octopart.com:443/CRCW040210K0FKEDHP-Vishay-datasheet-21226360.pdf?src-supplier=Newark; ComponentLink13Description: https://datasheet.octopart.com:443/CRCW040210K0FKEDHP-Vishay-datasheet-21226360.pdf?src-supplier=Newark; ComponentLink14URL: https://datasheet.octopart.com:443/CRCW040210K0FKEDHP-Vishay-Draloric-datasheet-8359436.pdf?src-supplier=Newark; ComponentLink14Description: https://datasheet.octopart.com:443/CRCW040210K0FKEDHP-Vishay-Draloric-datasheet-8359436.pdf?src-supplier=Newark; ComponentLink15URL: https://datasheet.octopart.com:443/CRCW040210K0FKEDHP-Vishay-datasheet-87136057.pdf?src-supplier=Farnell; ComponentLink15Description: https://datasheet.octopart.com:443/CRCW040210K0FKEDHP-Vishay-datasheet-87136057.pdf?src-supplier=Farnell; ComponentLink16URL: https://datasheet.octopart.com:443/CRCW040210K0FKEDHP-Vishay-datasheet-37143532.pdf?src-supplier=Farnell; ComponentLink16Description: https://datasheet.octopart.com:443/CRCW040210K0FKEDHP-Vishay-datasheet-37143532.pdf?src-supplier=Farnell; ComponentLink17URL: https://datasheet.octopart.com:443/CRCW040210K0FKEDHP-Vishay-datasheet-41195455.pdf?src-supplier=Farnell; ComponentLink17Description: https://datasheet.octopart.com:443/CRCW040210K0FKEDHP-Vishay-datasheet-41195455.pdf?src-supplier=Farnell; ComponentLink18URL: https://datasheet.octopart.com:443/CRCW040210K0FKEDHP.-Vishay-datasheet-66581887.pdf?src-supplier=Farnell; ComponentLink18Description: https://datasheet.octopart.com:443/CRCW040210K0FKEDHP.-Vishay-datasheet-66581887.pdf?src-supplier=Farnell; ComponentLink19URL: https://datasheet.octopart.com:443/CRCW040210K0FKEDHP-Vishay-datasheet-62317933.pdf?src-supplier=element14+APAC; ComponentLink19Description: https://datasheet.octopart.com:443/CRCW040210K0FKEDHP-Vishay-datasheet-62317933.pdf?src-supplier=element14+APAC; ComponentLink20URL: https://datasheet.octopart.com:443/CRCW040210K0FKEDHP-Vishay-Dale-datasheet-41169523.pdf?src-supplier=element14+APAC; ComponentLink20Description: https://datasheet.octopart.com:443/CRCW040210K0FKEDHP-Vishay-Dale-datasheet-41169523.pdf?src-supplier=element14+APAC; ComponentLink21URL: https://datasheet.octopart.com:443/CRCW040210K0FKEDHP-Vishay-datasheet-192322387.pdf?src-supplier=HQonline; ComponentLink21Description: https://datasheet.octopart.com:443/CRCW040210K0FKEDHP-Vishay-datasheet-192322387.pdf?src-supplier=HQonline; ComponentLink22URL: https://datasheet.octopart.com:443/CRCW040210K0FKEDHP-Vishay-datasheet-62316122.pdf?src-supplier=Future+Electronics; ComponentLink22Description: https://datasheet.octopart.com:443/CRCW040210K0FKEDHP-Vishay-datasheet-62316122.pdf?src-supplier=Future+Electronics; ComponentLink23URL: https://datasheet.octopart.com:443/CRCW040210K0FKEDHP-Vishay-Dale-datasheet-47688881.pdf?src-supplier=RS+(Formerly+Allied+Electronics); ComponentLink23Description: https://datasheet.octopart.com:443/CRCW040210K0FKEDHP-Vishay-Dale-datasheet-47688881.pdf?src-supplier=RS+(Formerly+Allied+Electronics); ComponentLink24URL: https://datasheet.octopart.com:443/CRCW040210K0FKEDHP-Vishay-datasheet-11548710.pdf?src-supplier=Arrow+Electronics; ComponentLink24Description: https://datasheet.octopart.com:443/CRCW040210K0FKEDHP-Vishay-datasheet-11548710.pdf?src-supplier=Arrow+Electronics; ComponentLink25URL: http://sigma.octopart.com:80/rohs_statement/Vishay-company-15.pdf?src-supplier=Compliance+Statements; ComponentLink25Description: http://sigma.octopart.com:80/rohs_statement/Vishay-company-15.pdf?src-supplier=Compliance+Statements; Supplier Part Number 1: 541-10.0KYDKR-ND
R11 = RCS04020000Z0ED: 0Ω Resistor, Jumper, 0402 [1005 Metric], Thick Film, 200 mW, 3 A, Surface Mount Device; Manufacturer: Vishay; Max Current Rating: 3A; Voltage Rating: 50V; Supplier 1: DigiKey; Manufacturer Part Number: RCS04020000Z0ED; RoHS: Compliant; Category: Chip SMD Resistors; Stock 1: 775160; Pricing 1: 1=0.1, 10=0.032, 25=0.0268, 50=0.0232, 100=0.0204, 250=0.01728, 500=0.01532, 1000=0.01364, 5000=0.01064 (USD); Case Code (Imperial): 0402; Case Code (Metric): 1005; China RoHS: Non-Compliant; Composition: Thick Film; Country of Origin: Israel, Mainland China; Export Control Classification Number (ECCN) Code: EAR99; Features: Automotive AEC-Q200; Height: 350µm; Harmonized Tariff Schedule (HTS) Code: 8533.21.00.30; Introduction Date: 2016-07-12; Length: 1mm; Lifecycle Status: Production; Max Operating Temperature: 155°C; Max Power Dissipation: 200mW; Min Operating Temperature: -55°C; Mount: Surface Mount; Number of Terminals: 2; Number of Terminations: 2; Ratings: AEC-Q200; REACH SVHC: Yes; Voltage Rating (DC): 50V; Width: 500µm; ComponentLink1URL: https://datasheet.octopart.com:443/RCS04020000Z0ED-Vishay-datasheet-176436275.pdf?src-supplier=IHS; ComponentLink1Description: https://datasheet.octopart.com:443/RCS04020000Z0ED-Vishay-datasheet-176436275.pdf?src-supplier=IHS; ComponentLink2URL: https://datasheet.octopart.com:443/RCS04020000Z0ED-Vishay-datasheet-86813749.pdf?src-supplier=Future+Electronics; ComponentLink2Description: https://datasheet.octopart.com:443/RCS04020000Z0ED-Vishay-datasheet-86813749.pdf?src-supplier=Future+Electronics; ComponentLink3URL: http://sigma.octopart.com:80/rohs_statement/Vishay-company-15.pdf?src-supplier=Compliance+Statements; ComponentLink3Description: http://sigma.octopart.com:80/rohs_statement/Vishay-company-15.pdf?src-supplier=Compliance+Statements; Supplier Part Number 1: 541-2877-6-ND
U9 U10 = TPD4E02B04DQAR: Tvs Diodes & Esd Suppressors; TPD4E02B04DQAR; Texas Instruments; 3.6 V; 8.8 V; 5.5 V; 6.4 V; Manufacturer Lifecycle Status: ACTIVE; Breakdown Voltage: 6.4V; Capacitance: 250fF; Clamping Voltage: 8.8V; Direction: Bidirectional; Interface: Ethernet; Min Breakdown Voltage: 5.5V; Number of Bidirectional Channels: 4; Operating Supply Voltage: 3.6V; Peak Pulse Current: 2A; Peak Pulse Power: 17W; Power Line Protection: No; Supplier 1: DigiKey; Manufacturer: Texas Instruments; Manufacturer Part Number: TPD4E02B04DQAR; RoHS: Compliant; Category: TVS Diodes; Stock 1: 7356; Pricing 1: 1=1.11, 10=0.694, 100=0.4535, 500=0.34992, 1000=0.31655 (USD); Ambient Temperature Range High: 125°C; Composition: Zener; Height: 550µm; Lead Free: Lead Free; Length: 2.5mm; Lifecycle Status: Production; Max Operating Temperature: 125°C; Min Operating Temperature: -40°C; Mount: Surface Mount; Number of Channels: 4; Number of Pins: 10; Packaging: Cut Tape; REACH SVHC: No; Reverse Standoff Voltage: 3.6V; Schedule B: 8541100080, 8541100080|8541100080|8541100080|8541100080|8541100080; Thickness: 500µm; Width: 1mm; ComponentLink1URL: https://sigma.octopart.com:443/176143083/technical_drawing/Texas-Instruments-TPD4E02B04DQAR.pdf?src-supplier=Texas+Instruments; ComponentLink1Description: https://sigma.octopart.com:443/176143083/technical_drawing/Texas-Instruments-TPD4E02B04DQAR.pdf?src-supplier=Texas+Instruments; ComponentLink2URL: https://octopart.com:443/opatz8j6/c1?t=aoqDSauUwmHle6qTDBhf01J_x3kMb2tNsy6DVVQxBhwMOFfKV8CkZQkeAg7HStYnhO7loO6NCnDu1YOrv9Z2JQczVlylZGWUOsI57_uevt2i4KjUmUJImJtsNsM8TsbJCJLZRzl3c-JHBOFgKjYzm3f4YkU-aqx3v6cxb1C_ME88aw5ttupZPGMLTNgyHtBJBcpA7ouznK1IKJV2UmyETiVI1pi24i54odCN60WXcAZMQqZ4PrsOmgAalftpno53H2KnyzLpeqa1D7K90IVfQHoOcpwRK6PpTcRmz9oJErDp9YFCGvc7QJo0rve7mXR72TJL87rmV4JS1nvPfqc5mZqgKm5dyfH3wfm-8AMgzoYYSqgqwA0y9g-vb7wUQDN8CkBv7YuzpFQ&src-supplier=Texas+Instruments; ComponentLink2Description: https://octopart.com:443/opatz8j6/c1?t=aoqDSauUwmHle6qTDBhf01J_x3kMb2tNsy6DVVQxBhwMOFfKV8CkZQkeAg7HStYnhO7loO6NCnDu1YOrv9Z2JQczVlylZGWUOsI57_uevt2i4KjUmUJImJtsNsM8TsbJCJLZRzl3c-JHBOFgKjYzm3f4YkU-aqx3v6cxb1C_ME88aw5ttupZPGMLTNgyHtBJBcpA7ouznK1IKJV2UmyETiVI1pi24i54odCN60WXcAZMQqZ4PrsOmgAalftpno53H2KnyzLpeqa1D7K90IVfQHoOcpwRK6PpTcRmz9oJErDp9YFCGvc7QJo0rve7mXR72TJL87rmV4JS1nvPfqc5mZqgKm5dyfH3wfm-8AMgzoYYSqgqwA0y9g-vb7wUQDN8CkBv7YuzpFQ&src-supplier=Texas+Instruments; ComponentLink3URL: https://datasheet.octopart.com:443/TPD4E02B04DQAR-Texas-Instruments-datasheet-59814757.pdf?src-supplier=Texas+Instruments; ComponentLink3Description: https://datasheet.octopart.com:443/TPD4E02B04DQAR-Texas-Instruments-datasheet-59814757.pdf?src-supplier=Texas+Instruments; ComponentLink4URL: https://sigma.octopart.com:443/49262242/technical_drawing/Texas-Instruments-TPD4E02B04DQAR.pdf?src-supplier=Texas+Instruments; ComponentLink4Description: https://sigma.octopart.com:443/49262242/technical_drawing/Texas-Instruments-TPD4E02B04DQAR.pdf?src-supplier=Texas+Instruments; ComponentLink5URL: https://datasheet.octopart.com:443/TPD4E02B04DQAR-Texas-Instruments-datasheet-95279696.pdf?src-supplier=Upverter; ComponentLink5Description: https://datasheet.octopart.com:443/TPD4E02B04DQAR-Texas-Instruments-datasheet-95279696.pdf?src-supplier=Upverter; ComponentLink6URL: https://datasheet.octopart.com:443/TPD4E02B04DQAR-Texas-Instruments-datasheet-66617599.pdf?src-supplier=element14+APAC; ComponentLink6Description: https://datasheet.octopart.com:443/TPD4E02B04DQAR-Texas-Instruments-datasheet-66617599.pdf?src-supplier=element14+APAC; ComponentLink7URL: https://datasheet.octopart.com:443/TPD4E02B04DQAR-Texas-Instruments-datasheet-62283090.pdf?src-supplier=Newark; ComponentLink7Description: https://datasheet.octopart.com:443/TPD4E02B04DQAR-Texas-Instruments-datasheet-62283090.pdf?src-supplier=Newark; ComponentLink8URL: https://datasheet.octopart.com:443/TPD4E02B04DQAR-Texas-Instruments-datasheet-164419877.pdf?src-supplier=Augswan; ComponentLink8Description: https://datasheet.octopart.com:443/TPD4E02B04DQAR-Texas-Instruments-datasheet-164419877.pdf?src-supplier=Augswan; ComponentLink9URL: https://datasheet.octopart.com:443/TPD4E02B04DQAR-Texas-Instruments-datasheet-159117911.pdf?src-supplier=LCSC; ComponentLink9Description: https://datasheet.octopart.com:443/TPD4E02B04DQAR-Texas-Instruments-datasheet-159117911.pdf?src-supplier=LCSC; ComponentLink10URL: https://datasheet.octopart.com:443/TPD4E02B04DQAR-Texas-Instruments-datasheet-164847889.pdf?src-supplier=Arrow.cn; ComponentLink10Description: https://datasheet.octopart.com:443/TPD4E02B04DQAR-Texas-Instruments-datasheet-164847889.pdf?src-supplier=Arrow.cn; ComponentLink11URL: https://datasheet.octopart.com:443/TPD4E02B04DQAR-Texas-Instruments-datasheet-137316104.pdf?src-supplier=Future+Electronics; ComponentLink11Description: https://datasheet.octopart.com:443/TPD4E02B04DQAR-Texas-Instruments-datasheet-137316104.pdf?src-supplier=Future+Electronics; ComponentLink12URL: http://sigma.octopart.com:80/reach_statement/Texas-Instruments-company-64.pdf?src-supplier=Compliance+Statements; ComponentLink12Description: http://sigma.octopart.com:80/reach_statement/Texas-Instruments-company-64.pdf?src-supplier=Compliance+Statements; ComponentLink13URL: http://sigma.octopart.com:80/conflict_mineral_statement/Texas-Instruments-company-63.pdf?src-supplier=Compliance+Statements; ComponentLink13Description: http://sigma.octopart.com:80/conflict_mineral_statement/Texas-Instruments-company-63.pdf?src-supplier=Compliance+Statements; Supplier Part Number 1: 296-43875-1-ND